# Altium schematic sheet Motion.SchDoc: Motion Control PCB
size A4; DrawnBy: AT; SheetNumber: 1; SheetTotal: 5
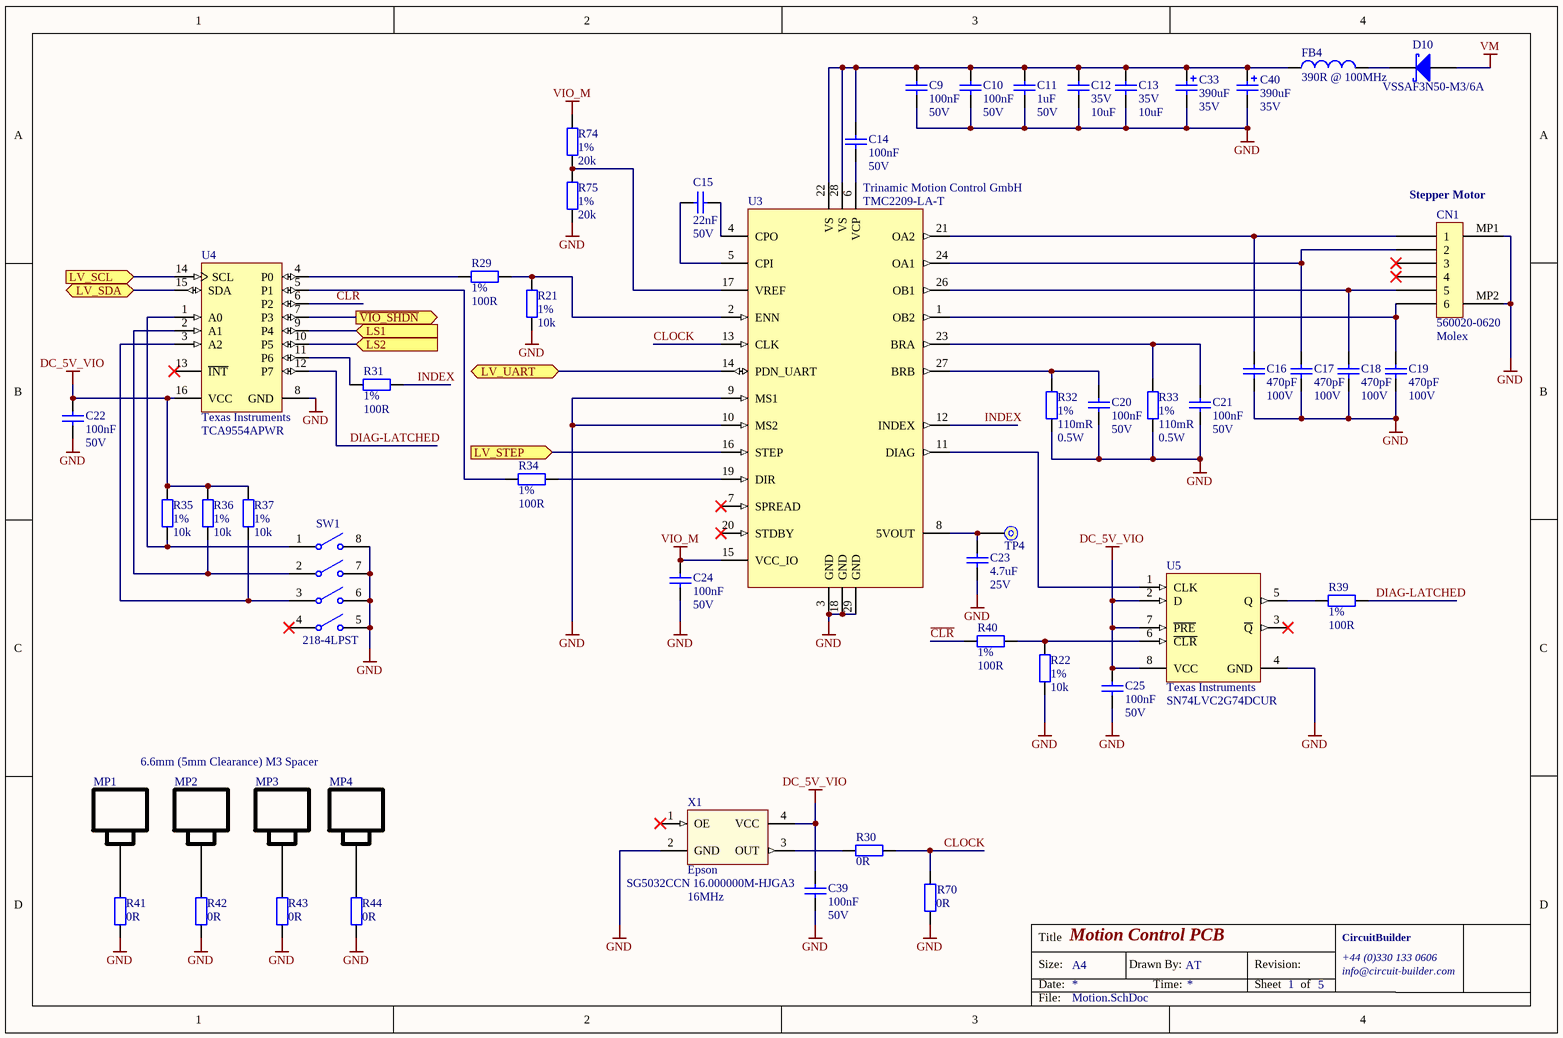
[diagram p0: Motion.SchDoc]

## Parts
C9  value 100nF  Voltage: 50V  [C0603]  (hidden comment: 100nF 0603 Ceramic Capacitor, 10%, X7R, 50V)
C10  value 100nF  Voltage: 50V  [C0603]  (hidden comment: 100nF 0603 Ceramic Capacitor, 10%, X7R, 50V)
C11  value 1uF  Voltage Rating: 50V  [C0603]  (hidden comment: 1uF 0603 Ceramic Capacitor, 10%, 50V, X5R)
C12  value 10uF  Voltage: 35V  [CAPC3225X22M]  (hidden comment: 10uF 1210 Ceramic Capacitor, 10%, 35V)
C13  value 10uF  Voltage: 35V  [CAPC3225X22M]  (hidden comment: 10uF 1210 Ceramic Capacitor, 10%, 35V)
C14  value 100nF  Voltage: 50V  [C0603]  (hidden comment: 100nF 0603 Ceramic Capacitor, 10%, X7R, 50V)
C15  value 22nF  Voltage: 50V  [C0603]  (hidden comment: 22nF 0603 Ceramic Capacitor, 5%, NP0, 50V)
C16  value 470pF  Voltage Rating: 100V  [C0603]  (hidden comment: 470pF 0603 Ceramic Capacitor, 5%, 100V, C0G)
C17  value 470pF  Voltage Rating: 100V  [C0603]  (hidden comment: 470pF 0603 Ceramic Capacitor, 5%, 100V, C0G)
C18  value 470pF  Voltage Rating: 100V  [C0603]  (hidden comment: 470pF 0603 Ceramic Capacitor, 5%, 100V, C0G)
C19  value 470pF  Voltage Rating: 100V  [C0603]  (hidden comment: 470pF 0603 Ceramic Capacitor, 5%, 100V, C0G)
C20  value 100nF  Voltage: 50V  [C0603]  (hidden comment: 100nF 0603 Ceramic Capacitor, 10%, X7R, 50V)
C21  value 100nF  Voltage: 50V  [C0603]  (hidden comment: 100nF 0603 Ceramic Capacitor, 10%, X7R, 50V)
C22  value 100nF  Voltage: 50V  [C0603]  (hidden comment: 100nF 0603 Ceramic Capacitor, 10%, X7R, 50V)
C23  value 4.7uF  Voltage: 25V  [C0603]  (hidden comment: 4.7uF 0603 Ceramic Capacitor, 10%, 25V)
C24  value 100nF  Voltage: 50V  [C0603]  (hidden comment: 100nF 0603 Ceramic Capacitor, 10%, X7R, 50V)
C25  value 100nF  Voltage: 50V  [C0603]  (hidden comment: 100nF 0603 Ceramic Capacitor, 10%, X7R, 50V)
C33  value 390uF  Voltage: 35V  [RADIAl-CAN-10MM-DIA]  (hidden comment: HYBRID SMD, 35V390UF 125DEGC 400)
C39  value 100nF  Voltage: 50V  [C0603]  (hidden comment: 100nF 0603 Ceramic Capacitor, 10%, X7R, 50V)
C40  value 390uF  Voltage: 35V  [RADIAl-CAN-10MM-DIA]  (hidden comment: HYBRID SMD, 35V390UF 125DEGC 400)
CN1  560020-0620  Manufacturer: Molex  [5600200620]
D10  ManufacturerPN: VSSAF3N50-M3/6A  [DO221AC-SLIMSMA]  (hidden comment: VSSAF3N50-M3_6A)
FB4  value 390R @ 100MHz  [R1206]  (hidden comment: FERRITE BEAD 390 OHM 1206 1LN)
MP1  6.6mm (5mm Clearance) M3 Spacer  [9775066960R]
MP2  6.6mm (5mm Clearance) M3 Spacer  [9775066960R]  (value not drawn)
MP3  6.6mm (5mm Clearance) M3 Spacer  [9775066960R]  (value not drawn)
MP4  6.6mm (5mm Clearance) M3 Spacer  [9775066960R]  (value not drawn)
R21  value 10k  Tolerance: 1%  [R0603]  (hidden comment: 10k 0603 Chip Resistor, 1%, 0.1W)
R22  value 10k  Tolerance: 1%  [R0603]  (hidden comment: 10k 0603 Chip Resistor, 1%, 0.1W)
R29  value 100R  Tolerance: 1%  [R0603]  (hidden comment: 100R 0603 Chip Resistor, 1%, 0.1W)
R30  value 0R  [R0603]  (hidden comment: 0R 0603 Chip Resistor)
R31  value 100R  Tolerance: 1%  [R0603]  (hidden comment: 100R 0603 Chip Resistor, 1%, 0.1W)
R32  value 110mR  Tolerance: 1%  Power: 0.5W  [R1206]  (hidden comment: 110mR 1206 Chip Resistor, 1%, 0.5W)
R33  value 110mR  Tolerance: 1%  Power: 0.5W  [R1206]  (hidden comment: 110mR 1206 Chip Resistor, 1%, 0.5W)
R34  value 100R  Tolerance: 1%  [R0603]  (hidden comment: 100R 0603 Chip Resistor, 1%, 0.1W)
R35  value 10k  Tolerance: 1%  [R0603]  (hidden comment: 10k 0603 Chip Resistor, 1%, 0.1W)
R36  value 10k  Tolerance: 1%  [R0603]  (hidden comment: 10k 0603 Chip Resistor, 1%, 0.1W)
R37  value 10k  Tolerance: 1%  [R0603]  (hidden comment: 10k 0603 Chip Resistor, 1%, 0.1W)
R39  value 100R  Tolerance: 1%  [R0603]  (hidden comment: 100R 0603 Chip Resistor, 1%, 0.1W)
R40  value 100R  Tolerance: 1%  [R0603]  (hidden comment: 100R 0603 Chip Resistor, 1%, 0.1W)
R41  value 0R  [R0603]  (hidden comment: 0R 0603 Chip Resistor)
R42  value 0R  [R0603]  (hidden comment: 0R 0603 Chip Resistor)
R43  value 0R  [R0603]  (hidden comment: 0R 0603 Chip Resistor)
R44  value 0R  [R0603]  (hidden comment: 0R 0603 Chip Resistor)
R70  value 0R  [R0603]  (hidden comment: 0R 0603 Chip Resistor)
R74  value 20k  Tolerance: 1%  [R0603]  (hidden comment: 20k 0603 Chip Resistor, 1%, 0.1W)
R75  value 20k  Tolerance: 1%  [R0603]  (hidden comment: 20k 0603 Chip Resistor, 1%, 0.1W)
SW1  SWITCH SLIDE DIP SPST 25MA 24V  [218-4LPST]  (value not drawn)
TP4  Test Point PTH  [Solder Point - 0.8mm Drill]  (value not drawn)  (no BOM)
U3  Manufacturer: Trinamic Motion Control GmbH  [QFN50P500X500X90_HS-29N]  (hidden comment: TMC2209-LA-T)
U4  Manufacturer: Texas Instruments  [PW16_N]  (hidden comment: TCA9554APWR)
U5  Manufacturer: Texas Instruments  [VSSOP8]  (hidden comment: SN74LVC2G74DCUR)
X1  value 16MHz  ManufacturerPN: SG5032CCN 16.000000M-HJGA3  Manufacturer: Epson  [SG5032]  (hidden comment: 16MHz XO (Standard) CMOS Oscillator 4.5V ~ 5.5V Enable/Disable 4-SMD, No Lead)

## Ports
LS1 (in), LS2 (in), LV_SCL (in), LV_SDA (bidir), LV_STEP (in), LV_UART (bidir), ~{VIO_SHDN} (out)

## Nets
DC_5V_VIO: C22.2 C25.2 C39.2 R35.2 R36.2 R37.2 U4.16(VCC) U5.2(D) U5.7(~{PRE}) U5.8(VCC) X1.4(VCC)
GND: C9.1 C10.1 C11.1 C12.2 C13.2 C16.1 C17.1 C18.1 C19.1 C20.1 C21.1 C22.1 C23.1 C24.1 C25.1 C33.- C39.1 C40.- CN1.MP1 CN1.MP2 R21.1 R22.1 R32.2 R33.1 R41.1 R42.1 R43.1 R44.1 R70.1 R75.1 SW1.5(S4B) SW1.6(S3B) SW1.7(S2B) SW1.8(S1B) U3.3(GND) U3.9(MS1) U3.10(MS2) U3.18(GND) U3.29(GND) U4.8(GND) U5.4(GND) X1.2(GND)
VIO_M: C24.2 R74.2 U3.15(VCC_IO)
VM: D10.1(A)
~{CLR}: R40.1 U4.6(P2)
CLOCK: R30.1 R70.2 U3.13(CLK)
DIAG-LATCHED: R39.2 U4.12(P7)
INDEX: R31.2 U3.12(INDEX)
LS1: U4.9(P4) ; port LS1
LS2: U4.10(P5) ; port LS2
LV_SCL: U4.14(SCL) ; port LV_SCL
LV_SDA: U4.15(SDA) ; port LV_SDA
LV_STEP: U3.16(STEP) ; port LV_STEP
LV_UART: U3.14(PDN_UART) ; port LV_UART
~{VIO_SHDN}: U4.7(P3) ; port ~{VIO_SHDN}
NetC9_2: C9.2 C10.2 C11.2 C12.1 C13.1 C14.2 C33.+ C40.+ FB4.1 U3.22(VS) U3.28(VS)
NetC14_1: C14.1 U3.6(VCP)
NetC15_1: C15.1 U3.5(CPI)
NetC15_2: C15.2 U3.4(CPO)
NetC16_2: C16.2 CN1.1 U3.21(OA2)
NetC17_2: C17.2 CN1.2 U3.24(OA1)
NetC18_2: C18.2 CN1.5 U3.26(OB1)
NetC19_2: C19.2 CN1.6 U3.1(OB2)
NetC20_2: C20.2 R32.1 U3.27(BRB)
NetC21_2: C21.2 R33.2 U3.23(BRA)
NetC23_2: C23.2 TP4.1 U3.8(5VOUT)
NetD10_2: D10.2(K) FB4.2
NetMP1_1: MP1.1 R41.2
NetMP2_1: MP2.1 R42.2
NetMP3_1: MP3.1 R43.2
NetMP4_1: MP4.1 R44.2
NetR21_2: R21.2 R29.2 U3.2(ENN)
NetR22_2: R22.2 R40.2 U5.6(~{CLR})
NetR29_1: R29.1 U4.4(P0)
NetR30_2: R30.2 X1.3(OUT)
NetR31_1: R31.1 U4.11(P6)
NetR34_1: R34.1 U4.5(P1)
NetR34_2: R34.2 U3.19(DIR)
NetR35_1: R35.1 SW1.1(S1A) U4.1(A0)
NetR36_1: R36.1 SW1.2(S2A) U4.2(A1)
NetR37_1: R37.1 SW1.3(S3A) U4.3(A2)
NetR39_1: R39.1 U5.5(Q)
NetR74_1: R74.1 R75.2 U3.17(VREF)
NetU3_11: U3.11(DIAG) U5.1(CLK)

Not connected (* = marked no-connect by the designer): CN1 3* 4*; SW1 4(S4A)*; U3 7(SPREAD)* 20(STDBY)*; U4 13(~{INT})*; U5 3(~{Q})*; X1 1(OE)*

## Notes on the sheet
- (near CN1) Stepper Motor
- Title
- Size:
- Date:
- A4
- Drawn By:
- Time:
- Revision:
- Sheet
- of
- CircuitBuilder
- +44 (0)330 133 0606
- info@circuit-builder.com
- File:

## Library data of the parts
C9 C10 C14 C20-C22 C24 C25 C39 = 100nF 0603 Ceramic Capacitor, 10%, X7R, 50V: Manufacturer: AVX; ManufacturerPN: 06035C104KAZ2A; Cost-10000: 0.0192; Supplier1: Farnell; Supplier1PN: 1301894; Cost: 0.0671; Package: 0603; Tolerance: 10%; Supplier2: Open Market; Supplier1PNProto: 1301894
C11 = 1uF 0603 Ceramic Capacitor, 10%, 50V, X5R: Manufacturer: Taiyo Yuden; ManufacturerPN: UMK107BJ105KA-T; Cost-10000: 0.0227; Supplier1: Farnell; Supplier1PN: 2112858; Cost: 0.11; Package: 0603; Tolerance: 10%; Supplier2: Open Market; Supplier1PNProto: 2112858; CreatedBy: AT
C12 C13 = 10uF 1210 Ceramic Capacitor, 10%, 35V: Flex Part Number: ROL-F120-0801; Manufacturer: Samsung Electro-Mechanics America; ManufacturerPN: CL32A106KLULNNE; Cost-10000: 0.08827; Supplier2: Open Market; Cost: 0.57; Supplier1: Digikey; Supplier1PN: 1276-3307-2-ND; Tolerance: 10%; Package: 1210; Supplier1PNProto: 1276-3307-1-ND
C15 = 22nF 0603 Ceramic Capacitor, 5%, NP0, 50V: Manufacturer: Samsung Electro-Mechanics America, Inc; ManufacturerPN: CL10B223JB8NNNC; Cost-10000: 0.03947; Supplier1: Digikey; Supplier1PN: 1276-1996-2-ND; Cost: 0.2; Package: 0603; Tolerance: 5%; Supplier2: Open Market; Flex Part Number: *; Supplier1PNProto: 1276-1996-1-ND
C16-C19 = 470pF 0603 Ceramic Capacitor, 5%, 100V, C0G: Manufacturer: Murata Electronics; ManufacturerPN: GCM1885C2A471JA16D; Cost-10000: 0.01; Supplier1: Digikey; Supplier1PN: 490-4949-2-ND; Cost: 0.17; Package: 0603; Tolerance: 5%; Supplier1PNProto: 490-4949-1-ND; CreatedBy: AT
C23 = 4.7uF 0603 Ceramic Capacitor, 10%, 25V_1: Manufacturer: Samsung Electro-Mechanics America, Inc; ManufacturerPN: CL10A475KA8NQNC; Flex Part Number: ROL-F120-0783; Cost-10000: 0.04744; Supplier1: Digikey; Supplier1PN: 1276-1900-2-ND; Cost: 0.22; Package: 0603; Tolerance: 10%; Supplier2: Open Market; Supplier1PNProto: 1276-1900-1-ND
C33 C40 = HYBRID SMD, 35V390UF 125DEGC 400: 390µF 35V Aluminum Polymer Capacitor Radial, Can - SMD 20mOhm 4000 Hrs @ 125°C; Manufacturer: Panasonic Electronic Components; ManufacturerPN: EEH-ZK1V391UP; Cost-10000: 0.608; Tolerance: 20%; Supplier1: Digikey; Supplier1PN: P125001CT-ND; Supplier2: Open Market; Cost: 1.75; Supplier1PNProto: P125001TR-ND
CN1 = 5600200620: Vertical SMT Header, 6-Way, 2mm Pitch; Circuits (maximum): 6; Cost-10000: 0.5; Circuits (Loaded): 6; Mounting Technology: Surface Mount; Number of Rows: 1; Supplier1: Digikey; Supplier1PN: WM10866RL-ND; Cost: 0.89; Supplier1PNProto: WM10866CT-ND; ManufacturerPN: 5600200620
D10 = VSSAF3N50-M3_6A: Diode Schottky 50V 2.7A (DC) Surface Mount DO-221AC (SlimSMA); Manufacturer: Vishay Semiconductor Diodes Division; Cost-10000: 0.1; Supplier1: Digikey; Supplier1PN: VSSAF3N50-M3/6AGITR-ND; Cost: 0.40; Package: DO221AC; Supplier1PNProto: VSSAF3N50-M3/6AGICT-ND
FB4 = FERRITE BEAD 390 OHM 1206 1LN: 390 Ohms @ 100MHz 1 Power Line Ferrite Bead 1206 (3216 Metric) 2A 50mOhm; Manufacturer: Murata Electronics; ManufacturerPN: BLM31PG391SN1L; Cost-10000: 0.07; Supplier1: Digikey; Supplier1PN: 490-5229-2-ND; Cost: 0.26; Supplier1PNProto: 490-5229-1-ND
MP1-MP4 = 9775066960R: Wurth 9775066960R 1mm Spacer; Manufacturer: Wurth Electronics Inc; Cost-10000: 0.686; ManufacturerPN: 9775066960R; Supplier1: Digikey; Supplier1PN: 732-10923-1-ND; Supplier1PNProto: 732-10923-2-ND; Cost: 1.03
R21 R22 R35-R37 = 10k 0603 Chip Resistor, 1%, 0.1W: Manufacturer: Samsung Electro-Mechanics America, Inc; ManufacturerPN: RC1608F103CS; Cost-10000: 0.00095; ProductionCost: 0.0012; Supplier1: Digikey; Supplier1PN: 1276-3485-2-ND; Cost: 0.07; Supplier1PNProto: 1276-3485-1-ND; ProductionSupplier: LCSC; ProductionSupplierPN: C115324; Supplier2: Open Market
R29 R31 R34 R39 R40 = 100R 0603 Chip Resistor, 1%, 0.1W: Manufacturer: Yageo; ManufacturerPN: RC0603FR-07100RL; Cost-10000: 0.003; ProductionCost: 0.0016; Supplier1: Digikey; Supplier1PN: 311-100HRTR-ND; Cost: 0.08; Supplier2: Open Market; Supplier1PNProto: 311-100HRCT-ND; ProductionSupplier: LCSC; ProductionSupplierPN: C105588
R30 R41-R44 R70 = 0R 0603 Chip Resistor: Manufacturer: Samsung Electro-Mechanics America, Inc; ManufacturerPN: RC1608J000CS; Flex Part Number: ROL-F130-1091; Cost-10000: 0.00053; Supplier1: Digikey; Supplier1PN: 1276-3510-2-ND; Cost: 0.07; Tolerance: N/A; Supplier2: Open Market; Supplier1PNProto: 1276-3510-1-ND
R32 R33 = 110mR 1206 Chip Resistor, 1%, 0.5W: Manufacturer: Panasonic Electronic Components; ManufacturerPN: ERJ-8BSFR11V; Cost-10000: 0.009; Supplier1: Digikey; Supplier1PN: P17679CT-ND; Cost: 0.08; Supplier2: Open Market; Supplier1PNProto: P17679CT-ND
R74 R75 = 20k 0603 Chip Resistor, 1%, 0.1W: Manufacturer: Vishay Dale; ManufacturerPN: CRCW060320K0FKEC; Cost-10000: 0.00095; Supplier1: Digikey; Supplier1PN: 541-2993-1-ND; Cost: 0.08; Supplier2: Open Market; Supplier1PNProto: 541-2993-1-ND
SW1 = 218-4LPST: Dip Switch SPST 4 Position Surface Mount Slide (Standard) Actuator 25mA 24VDC; Manufacturer: CTS Electrocomponents; Cost-10000: 0.52821; ManufacturerPN: 218-4LPST; Supplier1: Digikey; Supplier1PN: CT2184LPST-ND; Supplier1PNProto: CT2184LPST-ND; Cost: 0.98
U3 = TMC2209-LA-T: Bipolar Motor Driver Power MOSFET Step/Direction, UART 28-QFN (5x5); Cost-10000: 1.31; Supplier1: Digikey; Supplier1PN: 1460-1398-2-ND; Supplier1PNProto: 1460-1398-1-ND; Cost: 2.25; ManufacturerPN: TMC2209-LA-T
U4 = TCA9554APWR: Remote 8-Bit I2C and SMBus I/O Expander, 8 Outputs, 1.65 to 5.5 V, -40 to 85 degC, 16-pin TSSOP (PW), Green (RoHS & no Sb/Br); Supplier1: Digi-Key; Supplier1PN: 296-28120-2-ND; Supplier1PNProto: 296-28120-1-ND; Cost: 1.12; ManufacturerPN: TCA9554APWR
U5 = SN74LVC2G74DCUR IC FF D-TYPE SNGL 1BIT US8: Flip Flop 1 Element D-Type 1 Bit Positive Edge 8-VFSOP; Cost-10000: 0.17; Supplier1: Digikey; Supplier1PN: 296-12755-2-ND; Cost: 0.45; Supplier1PNProto: 296-12755-1-ND; ManufacturerPN: SN74LVC2G74DCUR
X1 = XTAL OSC XO 16.0000MHZ CMOS SMD: Cost-10000: 0.45; Tolerance: +/- 50ppm; Cost: 0.92; Supplier1: Digikey; Supplier1PN: SER4363TR-ND; Supplier1PNProto: SER4363CT-ND